# Altium project KIT_ARDUINO_ConVariante_R00.PrjPcb
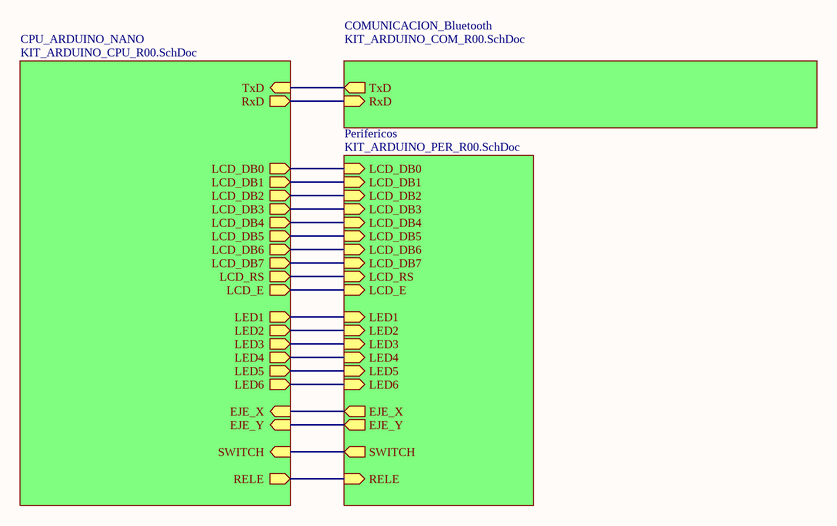
[diagram p0: KIT_ARDUINO_BLK_R00.SchDoc]
4 sheets, 26 parts. Net scope: hierarchical (ports join the sheet entries above them; power ports are global).
Board file: KIT_ARDUINO_R00.PcbDoc
Sheets:
  KIT_ARDUINO_BLK_R00.SchDoc
    CPU_ARDUINO_NANO = KIT_ARDUINO_CPU_R00.SchDoc
    Perifericos = KIT_ARDUINO_PER_R00.SchDoc
    COMUNICACION_Bluetooth = KIT_ARDUINO_COM_R00.SchDoc

## Sheet KIT_ARDUINO_BLK_R00.SchDoc: KIT ARDUINO 2022
size A4; Author: Valeria Bank; CompanyName: Sistemas De Representacion; Revision: R00; SheetNumber: 1; SheetTotal: 4

### Sub-sheets
COMUNICACION_Bluetooth = KIT_ARDUINO_COM_R00.SchDoc: TxD (out), RxD (in)
CPU_ARDUINO_NANO = KIT_ARDUINO_CPU_R00.SchDoc: TxD (in), RxD (out), LCD_DB0 (out), LCD_DB1 (out), LCD_DB2 (out), LCD_DB3 (out), LCD_DB4 (out), LCD_DB5 (out), LCD_DB6 (out), LCD_DB7 (out), LCD_RS (out), LCD_E (out), LED2 (out), LED3 (out), LED4 (out), EJE_X (in), EJE_Y (in), LED1 (out), SWITCH (in), RELE (out), LED5 (out), LED6 (out)
Perifericos = KIT_ARDUINO_PER_R00.SchDoc: LCD_DB0 (in), LCD_DB1 (in), LCD_DB2 (in), LCD_DB3 (in), LCD_DB4 (in), LCD_DB5 (in), LCD_DB6 (in), LCD_DB7 (in), LCD_RS (in), LCD_E (in), LED1 (in), LED2 (in), LED3 (in), LED4 (in), EJE_X (out), EJE_Y (out), SWITCH (out), RELE (in), LED5 (in), LED6 (in)

### Nets
EJE_X: sheet CPU_ARDUINO_NANO/EJE_X, sheet Perifericos/EJE_X
EJE_Y: sheet CPU_ARDUINO_NANO/EJE_Y, sheet Perifericos/EJE_Y
LCD_DB0: sheet CPU_ARDUINO_NANO/LCD_DB0, sheet Perifericos/LCD_DB0
LCD_DB1: sheet CPU_ARDUINO_NANO/LCD_DB1, sheet Perifericos/LCD_DB1
LCD_DB2: sheet CPU_ARDUINO_NANO/LCD_DB2, sheet Perifericos/LCD_DB2
LCD_DB3: sheet CPU_ARDUINO_NANO/LCD_DB3, sheet Perifericos/LCD_DB3
LCD_DB4: sheet CPU_ARDUINO_NANO/LCD_DB4, sheet Perifericos/LCD_DB4
LCD_DB5: sheet CPU_ARDUINO_NANO/LCD_DB5, sheet Perifericos/LCD_DB5
LCD_DB6: sheet CPU_ARDUINO_NANO/LCD_DB6, sheet Perifericos/LCD_DB6
LCD_DB7: sheet CPU_ARDUINO_NANO/LCD_DB7, sheet Perifericos/LCD_DB7
LCD_E: sheet CPU_ARDUINO_NANO/LCD_E, sheet Perifericos/LCD_E
LCD_RS: sheet CPU_ARDUINO_NANO/LCD_RS, sheet Perifericos/LCD_RS
LED1: sheet CPU_ARDUINO_NANO/LED1, sheet Perifericos/LED1
LED2: sheet CPU_ARDUINO_NANO/LED2, sheet Perifericos/LED2
LED3: sheet CPU_ARDUINO_NANO/LED3, sheet Perifericos/LED3
LED4: sheet CPU_ARDUINO_NANO/LED4, sheet Perifericos/LED4
LED5: sheet CPU_ARDUINO_NANO/LED5, sheet Perifericos/LED5
LED6: sheet CPU_ARDUINO_NANO/LED6, sheet Perifericos/LED6
RELE: sheet CPU_ARDUINO_NANO/RELE, sheet Perifericos/RELE
RxD: sheet CPU_ARDUINO_NANO/RxD, sheet COMUNICACION_Bluetooth/RxD
SWITCH: sheet CPU_ARDUINO_NANO/SWITCH, sheet Perifericos/SWITCH
TxD: sheet CPU_ARDUINO_NANO/TxD, sheet COMUNICACION_Bluetooth/TxD

### Notes on the sheet
- Title:
- Size:
- Author:
- A4
- Sheet
- of
- Revision:
- File:
- Date:

## Sheet KIT_ARDUINO_CPU_R00.SchDoc: KIT ARDUINO 2022
size A4; Author: Valeria Bank; CompanyName: Sistemas De Representacion; Revision: R00; SheetNumber: 2; SheetTotal: 4
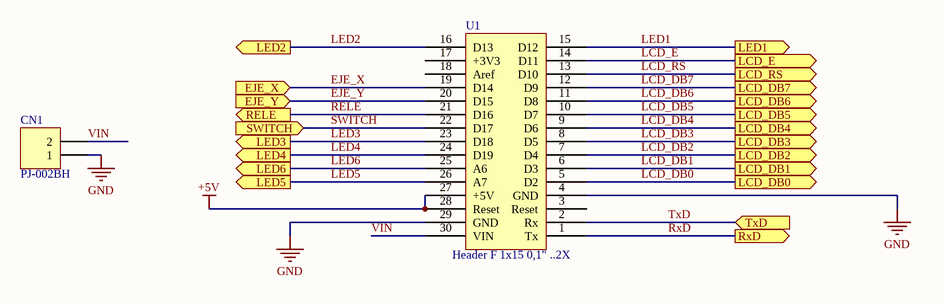
[diagram p1: KIT_ARDUINO_CPU_R00.SchDoc]

### Parts
CN1  PJ-002BH  [PJ002B]
U1  Header F 1x15 0,1" ..2X  [Arduino Nano]

### Ports
EJE_X (in), EJE_Y (in), LCD_DB0 (out), LCD_DB1 (out), LCD_DB2 (out), LCD_DB3 (out), LCD_DB4 (out), LCD_DB5 (out), LCD_DB6 (out), LCD_DB7 (out), LCD_E (out), LCD_RS (out), LED1 (out), LED2 (out), LED3 (out), LED4 (out), LED5 (out), LED6 (out), RELE (out), RxD (out), SWITCH (in), TxD (in)

### Nets
+5V: U1.27(+5V) U1.28(Reset)
GND: CN1.1 U1.4(GND) U1.29(GND)
EJE_X: U1.19(D14) ; port EJE_X
EJE_Y: U1.20(D15) ; port EJE_Y
LCD_DB0: U1.5(D2) ; port LCD_DB0
LCD_DB1: U1.6(D3) ; port LCD_DB1
LCD_DB2: U1.7(D4) ; port LCD_DB2
LCD_DB3: U1.8(D5) ; port LCD_DB3
LCD_DB4: U1.9(D6) ; port LCD_DB4
LCD_DB5: U1.10(D7) ; port LCD_DB5
LCD_DB6: U1.11(D8) ; port LCD_DB6
LCD_DB7: U1.12(D9) ; port LCD_DB7
LCD_E: U1.14(D11) ; port LCD_E
LCD_RS: U1.13(D10) ; port LCD_RS
LED1: U1.15(D12) ; port LED1
LED2: U1.16(D13) ; port LED2
LED3: U1.23(D18) ; port LED3
LED4: U1.24(D19) ; port LED4
LED5: U1.26(A7) ; port LED5
LED6: U1.25(A6) ; port LED6
RELE: U1.21(D16) ; port RELE
RxD: U1.1(Tx) ; port RxD
SWITCH: U1.22(D17) ; port SWITCH
TxD: U1.2(Rx) ; port TxD
VIN: CN1.2 U1.30(VIN)

Not connected (* = marked no-connect by the designer): U1 3(Reset) 17(+3V3) 18(Aref)

### Notes on the sheet
- Title:
- Size:
- Author:
- A4
- Sheet
- of
- Revision:
- File:
- Date:

### Library data of the parts
CN1 = Header 2: Header, 2-Pin; LatestRevisionDate: 17-Jul-2002; LatestRevisionNote: Re-released for DXP Platform.; Publisher: Altium Limited
U1 = Arduino Nano: Microcontroller

## Sheet KIT_ARDUINO_PER_R00.SchDoc: KIT ARDUINO 2022
size A4; Author: Valeria Bank; CompanyName: Sistemas De Representacion; Revision: R00; SheetNumber: 3; SheetTotal: 4; SPICEModelCacheQUHMHHDS: <root> / <DocumentId>QUHMHHDS</DocumentId> / <CacheFrame Number="0"> / <Model Name="res" Kind="MDL"> / <Text>*Default semiconductor resistor / .MODEL RES R()</Text> / </Model> / <Model Name="led0" Kind="MDL"> / <Text>*Typ INFRARED GaAs LED: Vf=1.2V Vr=5V If=40mA trr=3uS / *LED Pinout: 1=A, 2=K / .MODEL LED0 D (IS=93.5P RS=84M N=2.63 BV=5 IBV=10U / + CJO=2.97P VJ=.75 M=.333 TT=4.32U)</Text> / </Model> / <Model Name="npn" Kind="MDL"> / <Text>*Default NPN BJT / *NPN Trans Pinout: C,B,E / .MODEL NPN NPN()</Text> / </Model> / <Model Name="diode" Kind="MDL"> / <Text>*Default Diode / *Diode Pinout: A,K / .MODEL DIODE D()</Text> / </Model> / </CacheFrame> / </root>
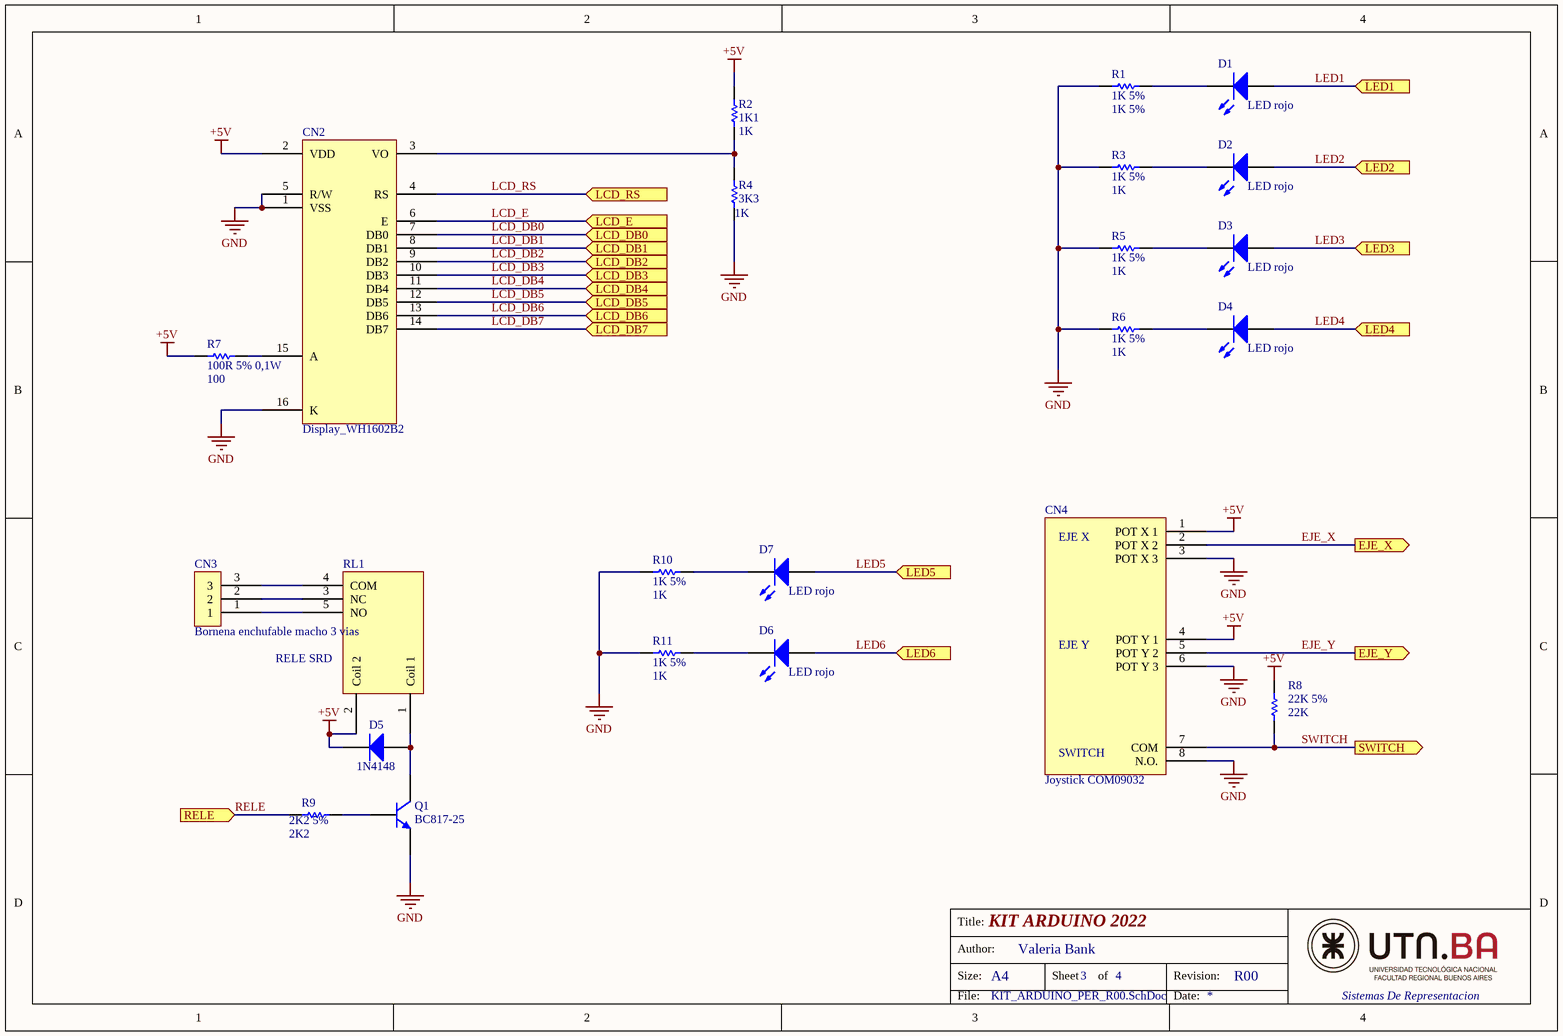
[diagram p2: KIT_ARDUINO_PER_R00.SchDoc]

### Parts
CN2  Display_WH1602B2  [WH1602B]
CN3  Bornena enchufable macho 3 vias  [BORNERA-3 VIAS]
CN4  Joystick COM09032  [Joystick 4398]
D1  LED rojo  [LED 5MM]
D2  LED rojo  [LED 5MM]
D3  LED rojo  [LED 5MM]
D4  LED rojo  [LED 5MM]
D5  1N4148  [SOD_323]
D6  LED rojo  [LED 5MM]
D7  LED rojo  [LED 5MM]
Q1  BC817-25  [SOT_23]
R1  1K 5%  [R_0805]
R2  1K1  value 1K  [R_0805]
R3  1K 5%  value 1K  [R_0805]
R4  3K3  value 1K  [R_0805]
R5  1K 5%  value 1K  [R_0805]
R6  1K 5%  value 1K  [R_0805]
R7  100R 5% 0,1W  value 100  [R_0805]
R8  22K 5%  value 22K  [R_0805]
R9  2K2 5%  value 2K2  [R_0805]
R10  1K 5%  value 1K  [R_0805]
R11  1K 5%  value 1K  [R_0805]
RL1  RELE SRD  [Relay]

### Ports
EJE_X (out), EJE_Y (out), LCD_DB0 (in), LCD_DB1 (in), LCD_DB2 (in), LCD_DB3 (in), LCD_DB4 (in), LCD_DB5 (in), LCD_DB6 (in), LCD_DB7 (in), LCD_E (in), LCD_RS (in), LED1 (in), LED2 (in), LED3 (in), LED4 (in), LED5 (in), LED6 (in), RELE (in), SWITCH (out)

### Nets
+5V: CN2.2(VDD) CN4.1(POT_X_1) CN4.4(POT_Y_1) D5.2(K) R2.2 R7.1 R8.2 RL1.2(Coil_2)
GND: CN2.1(VSS) CN2.5(R/W) CN2.16(K) CN4.3(POT_X_3) CN4.6(POT_Y_3) CN4.8(N.O.) Q1.3(E) R1.1 R3.1 R4.1 R5.1 R6.1 R10.1 R11.1
EJE_X: CN4.2(POT_X_2) ; port EJE_X
EJE_Y: CN4.5(POT_Y_2) ; port EJE_Y
LCD_DB0: CN2.7(DB0) ; port LCD_DB0
LCD_DB1: CN2.8(DB1) ; port LCD_DB1
LCD_DB2: CN2.9(DB2) ; port LCD_DB2
LCD_DB3: CN2.10(DB3) ; port LCD_DB3
LCD_DB4: CN2.11(DB4) ; port LCD_DB4
LCD_DB5: CN2.12(DB5) ; port LCD_DB5
LCD_DB6: CN2.13(DB6) ; port LCD_DB6
LCD_DB7: CN2.14(DB7) ; port LCD_DB7
LCD_E: CN2.6(E) ; port LCD_E
LCD_RS: CN2.4(RS) ; port LCD_RS
LED1: D1.1(A) ; port LED1
LED2: D2.1(A) ; port LED2
LED3: D3.1(A) ; port LED3
LED4: D4.1(A) ; port LED4
LED5: D7.1(A) ; port LED5
LED6: D6.1(A) ; port LED6
RELE: R9.1 ; port RELE
SWITCH: CN4.7(COM) R8.1 ; port SWITCH
NetCN2_3: CN2.3(VO) R2.1 R4.2
NetCN2_15: CN2.15(A) R7.2
NetCN3_1: CN3.1 RL1.5(NO)
NetCN3_2: CN3.2 RL1.3(NC)
NetCN3_3: CN3.3 RL1.4(COM)
NetD1_2: D1.2(K) R1.2
NetD2_2: D2.2(K) R3.2
NetD3_2: D3.2(K) R5.2
NetD4_2: D4.2(K) R6.2
NetD5_1: D5.1(A) Q1.1(C) RL1.1(Coil_1)
NetD6_2: D6.2(K) R11.2
NetD7_2: D7.2(K) R10.2
NetQ1_2: Q1.2(B) R9.2

### Notes on the sheet
- Title:
- Size:
- Author:
- A4
- Sheet
- of
- Revision:
- File:
- Date:
- (in symbol Joystick COM09032) EJE X; EJE Y; SWITCH

### Library data of the parts
CN3 = Header 3x
D1-D4 D6 D7 = LED0: Typical INFRARED GaAs LED; Published: 8-Jun-2000; LatestRevisionDate: 08-Jul-2005; LatestRevisionNote: Mech Layer 1 removed.; PackageReference: LED-0; Publisher: Altium Limited; PackageDescription: LED; 2 Leads
D5 = Diode: Default Diode; Published: 8-Jun-2000; LatestRevisionDate: 17-Jul-2002; LatestRevisionNote: Re-released for DXP Platform.; PackageVersion: Sep-1996; PackageReference: SMC; Publisher: Altium Limited; PackageDescription: DO-214-AB/SMC; 2 C-Bend Leads; Body 7.9 x 5.9 mm, inc. leads (LxW); Code_JEDEC: DO-214-AB
Q1 = NPN: NPN Bipolar Transistor; Published: 8-Jun-2000; LatestRevisionDate: 17-Jul-2002; LatestRevisionNote: Re-released for DXP Platform.; PackageReference: TO-226-AA; Publisher: Altium Limited; PackageDescription: TO, Flat Index; 3 In-Line, Axial Leads; Body Dia. 4.8mm; Leads 0.55 x 0.51 mm (max); Code_JEDEC: TO-226-AA
R1-R11 = Res Semi: Semiconductor Resistor; Published: 8-Jun-2000; LatestRevisionDate: 17-Jul-2002; LatestRevisionNote: Re-released for DXP Platform.; PackageReference: AXIAL-0.5; Publisher: Altium Limited; PackageDescription: Axial Device, Thru-Hole; 2 Leads; 0.5 in Pin Spacing
  R1: Value: 1K 5%

## Sheet KIT_ARDUINO_COM_R00.SchDoc: KIT ARDUINO 2022
size A4; Author: Valeria Bank; CompanyName: Sistemas De Representacion; Revision: R00; SheetNumber: 4; SheetTotal: 4
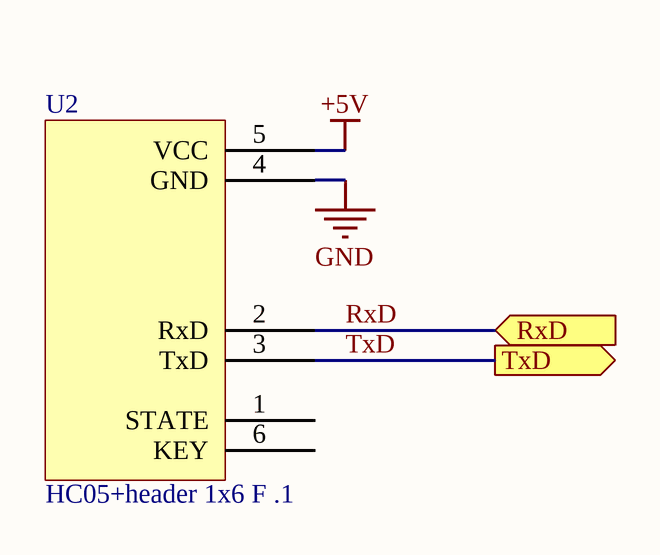
[diagram p3: KIT_ARDUINO_COM_R00.SchDoc]

### Parts
U2  HC05+header 1x6 F .1  [HEADER F 1x6 .1" Horizintal]

### Ports
RxD (in), TxD (out)

### Nets
+5V: U2.5(VCC)
GND: U2.4(GND)
RxD: U2.2(RxD) ; port RxD
TxD: U2.3(TxD) ; port TxD

Not connected (* = marked no-connect by the designer): U2 1(STATE) 6(KEY)

### Notes on the sheet
- Title:
- Size:
- Author:
- A4
- Sheet
- of
- Revision:
- File:
- Date:

### Library data of the parts
U2 = HC05

## Nets that join several sheets
+5V: KIT_ARDUINO_CPU_R00 (U1.27 U1.28), KIT_ARDUINO_PER_R00 (8 pins), KIT_ARDUINO_COM_R00 (U2.5)
GND: KIT_ARDUINO_CPU_R00 (CN1.1 U1.4 U1.29), KIT_ARDUINO_PER_R00 (14 pins), KIT_ARDUINO_COM_R00 (U2.4)
EJE_X: KIT_ARDUINO_CPU_R00 (U1.19), KIT_ARDUINO_PER_R00 (CN4.2)
EJE_Y: KIT_ARDUINO_CPU_R00 (U1.20), KIT_ARDUINO_PER_R00 (CN4.5)
LCD_DB0: KIT_ARDUINO_CPU_R00 (U1.5), KIT_ARDUINO_PER_R00 (CN2.7)
LCD_DB1: KIT_ARDUINO_CPU_R00 (U1.6), KIT_ARDUINO_PER_R00 (CN2.8)
LCD_DB2: KIT_ARDUINO_CPU_R00 (U1.7), KIT_ARDUINO_PER_R00 (CN2.9)
LCD_DB3: KIT_ARDUINO_CPU_R00 (U1.8), KIT_ARDUINO_PER_R00 (CN2.10)
LCD_DB4: KIT_ARDUINO_CPU_R00 (U1.9), KIT_ARDUINO_PER_R00 (CN2.11)
LCD_DB5: KIT_ARDUINO_CPU_R00 (U1.10), KIT_ARDUINO_PER_R00 (CN2.12)
LCD_DB6: KIT_ARDUINO_CPU_R00 (U1.11), KIT_ARDUINO_PER_R00 (CN2.13)
LCD_DB7: KIT_ARDUINO_CPU_R00 (U1.12), KIT_ARDUINO_PER_R00 (CN2.14)
LCD_E: KIT_ARDUINO_CPU_R00 (U1.14), KIT_ARDUINO_PER_R00 (CN2.6)
LCD_RS: KIT_ARDUINO_CPU_R00 (U1.13), KIT_ARDUINO_PER_R00 (CN2.4)
LED1: KIT_ARDUINO_CPU_R00 (U1.15), KIT_ARDUINO_PER_R00 (D1.1)
LED2: KIT_ARDUINO_CPU_R00 (U1.16), KIT_ARDUINO_PER_R00 (D2.1)
LED3: KIT_ARDUINO_CPU_R00 (U1.23), KIT_ARDUINO_PER_R00 (D3.1)
LED4: KIT_ARDUINO_CPU_R00 (U1.24), KIT_ARDUINO_PER_R00 (D4.1)
LED5: KIT_ARDUINO_CPU_R00 (U1.26), KIT_ARDUINO_PER_R00 (D7.1)
LED6: KIT_ARDUINO_CPU_R00 (U1.25), KIT_ARDUINO_PER_R00 (D6.1)
RELE: KIT_ARDUINO_CPU_R00 (U1.21), KIT_ARDUINO_PER_R00 (R9.1)
RxD: KIT_ARDUINO_CPU_R00 (U1.1), KIT_ARDUINO_COM_R00 (U2.2)
SWITCH: KIT_ARDUINO_CPU_R00 (U1.22), KIT_ARDUINO_PER_R00 (CN4.7 R8.1)
TxD: KIT_ARDUINO_CPU_R00 (U1.2), KIT_ARDUINO_COM_R00 (U2.3)